# Altium schematic sheet DAP.SchDoc: Skipper DAP
size 297 x 210 mm; Author: Jack Herron; SheetNumber: 9; SheetTotal: 11
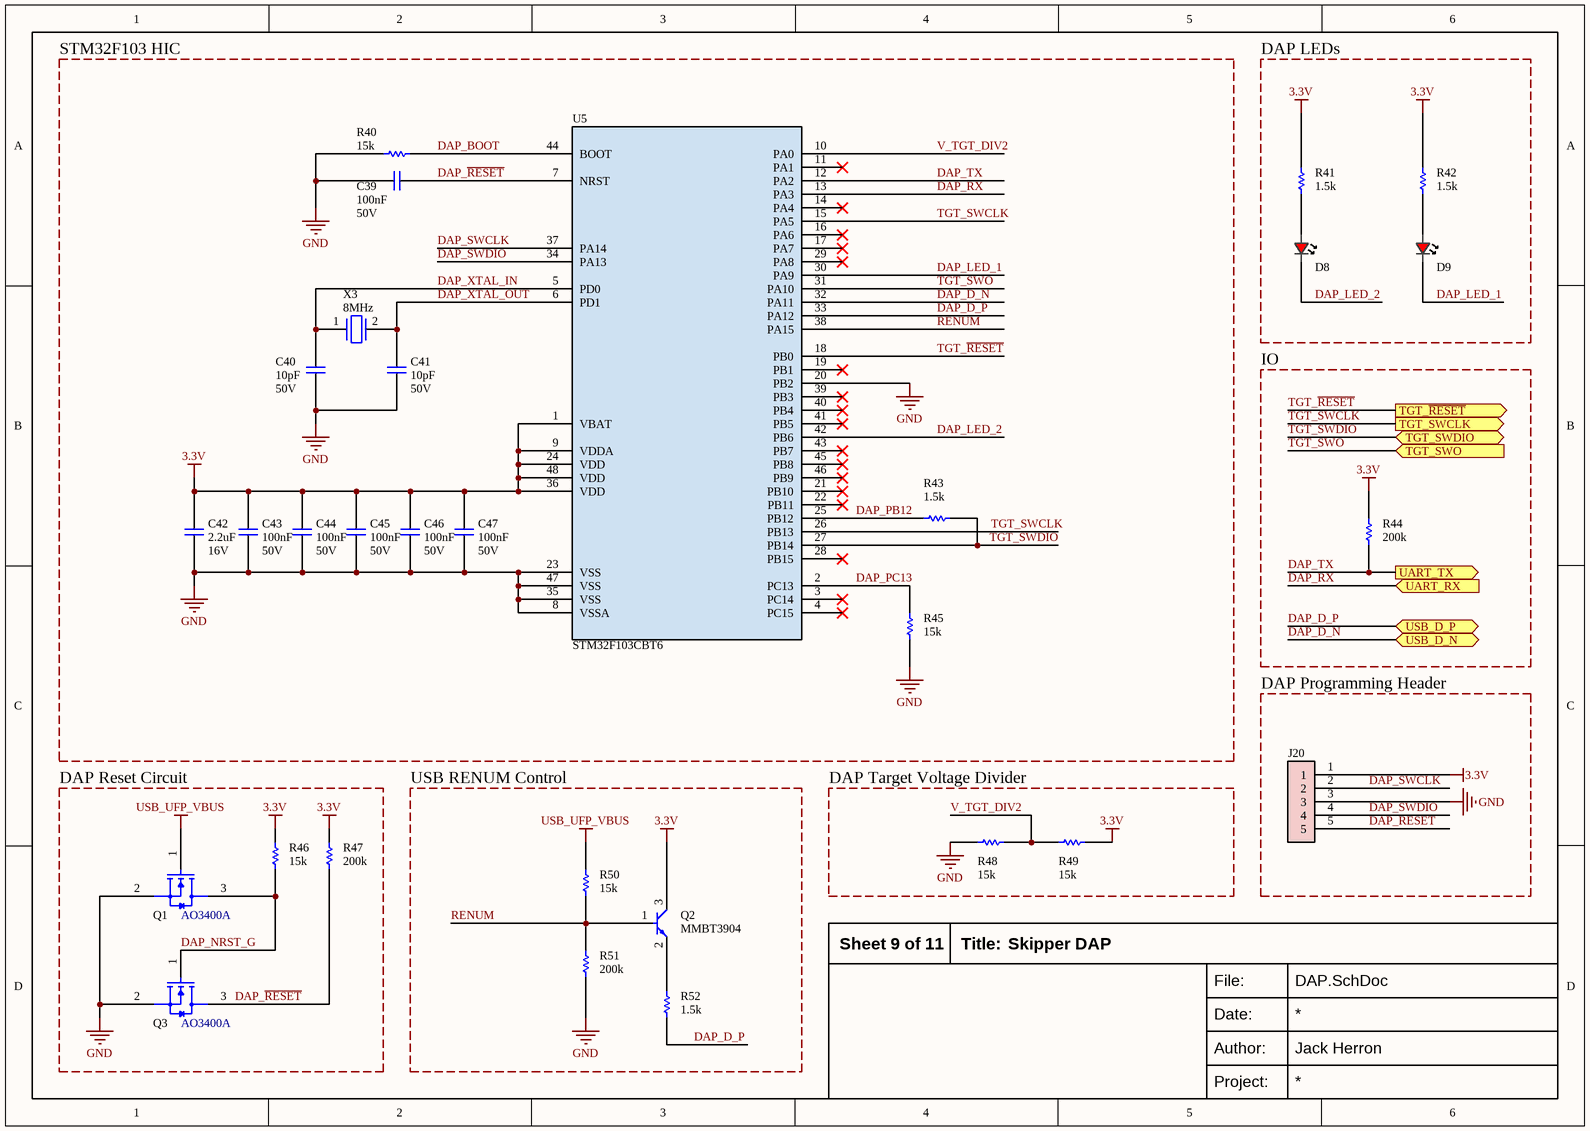
[diagram p0: DAP.SchDoc]

## Parts
C39  value 100nF  Voltage: 50V  [CAPACITOR-0402]  (hidden comment: CL05B104KB54PNC)
C40  value 10pF  Voltage: 50V  [CAPACITOR-0402]  (hidden comment: CL05C100JB5NNNC)
C41  value 10pF  Voltage: 50V  [CAPACITOR-0402]  (hidden comment: CL05C100JB5NNNC)
C42  value 2.2uF  Voltage: 16V  [CAPACITOR-0603]  (hidden comment: CL10A225KO8NNNC)
C43  value 100nF  Voltage: 50V  [CAPACITOR-0402]  (hidden comment: CL05B104KB54PNC)
C44  value 100nF  Voltage: 50V  [CAPACITOR-0402]  (hidden comment: CL05B104KB54PNC)
C45  value 100nF  Voltage: 50V  [CAPACITOR-0402]  (hidden comment: CL05B104KB54PNC)
C46  value 100nF  Voltage: 50V  [CAPACITOR-0402]  (hidden comment: CL05B104KB54PNC)
C47  value 100nF  Voltage: 50V  [CAPACITOR-0402]  (hidden comment: CL05B104KB54PNC)
D8  KT-0603R  [LED-0603]  (value not drawn)
D9  KT-0603R  [LED-0603]  (value not drawn)
J20  Connector_2.54mm-1x5-unpopulated  [CONNECTOR_Header_2.54mm_1x5]  (value not drawn)  (no BOM)
Q1  AO3400A  [SOT23-3]
Q2  MMBT3904  [SOT23-3]
Q3  AO3400A  [SOT23-3]
R40  value 15k  [RESISTOR-0402]  (hidden comment: 0402WGF1502TCE)
R41  value 1.5k  [RESISTOR-0402]  (hidden comment: 0402WGF1501TCE)
R42  value 1.5k  [RESISTOR-0402]  (hidden comment: 0402WGF1501TCE)
R43  value 1.5k  [RESISTOR-0402]  (hidden comment: 0402WGF1501TCE)
R44  value 200k  [RESISTOR-0402]  (hidden comment: 0402WGF2003TCE)
R45  value 15k  [RESISTOR-0402]  (hidden comment: 0402WGF1502TCE)
R46  value 15k  [RESISTOR-0402]  (hidden comment: 0402WGF1502TCE)
R47  value 200k  [RESISTOR-0402]  (hidden comment: 0402WGF2003TCE)
R48  value 15k  [RESISTOR-0402]  (hidden comment: 0402WGF1502TCE)
R49  value 15k  [RESISTOR-0402]  (hidden comment: 0402WGF1502TCE)
R50  value 15k  [RESISTOR-0402]  (hidden comment: 0402WGF1502TCE)
R51  value 200k  [RESISTOR-0402]  (hidden comment: 0402WGF2003TCE)
R52  value 1.5k  [RESISTOR-0402]  (hidden comment: 0402WGF1501TCE)
U5  STM32F103CBT6  [LQFP-48-7x7]
X3  value 8MHz  [CRYSTAL_3225-2P]  (hidden comment: NX3225GD-8MHZ-STD-CRA-3)

## Blocks framed on the sheet
STM32F103 HIC: C39-C47 R40 R43 R45 U5 X3
DAP LEDs: D8 D9 R41 R42
IO: R44
DAP Programming Header: J20
DAP Reset Circuit: Q1 Q3 R46 R47
USB RENUM Control: Q2 R50-R52
DAP Target Voltage Divider: R48 R49

## Ports
TGT_SWCLK (out, see Top_Sheet[3C]), TGT_SWDIO (bidir, see Top_Sheet[3C]), TGT_SWO (in, see Top_Sheet[3C]), TGT_~{RESET} (out, see Top_Sheet[3C]), UART_RX (in, see Top_Sheet[3C]), UART_TX (out, see Top_Sheet[3C]), USB_D_N (bidir, see Top_Sheet[3D]), USB_D_P (bidir, see Top_Sheet[3D])

## Nets
3.3V: C42.2 C43.2 C44.2 C45.2 C46.2 C47.2 J20.1 Q2.3(C) R41.2 R42.2 R44.2 R46.2 R47.2 R49.1 U5.1(VBAT) U5.9(VDDA) U5.24(VDD) U5.36(VDD) U5.48(VDD)
GND: C39.2 C40.1 C41.1 C42.1 C43.1 C44.1 C45.1 C46.1 C47.1 J20.3 Q1.2(S) Q3.2(S) R40.1 R45.1 R48.2 R51.1 U5.8(VSSA) U5.20(PB2) U5.23(VSS) U5.35(VSS) U5.47(VSS)
USB_UFP_VBUS: Q1.1(G) R50.2
DAP_BOOT: R40.2 U5.44(BOOT)
DAP_D_N: U5.32(PA11) ; port USB_D_N
DAP_D_P: R52.1 U5.33(PA12) ; port USB_D_P
DAP_LED_1: D9.K U5.30(PA9)
DAP_LED_2: D8.K U5.42(PB6)
DAP_NRST_G: Q1.3(D) Q3.1(G) R46.1
DAP_PB12: R43.2 U5.25(PB12)
DAP_PC13: R45.2 U5.2(PC13)
DAP_~{RESET}: C39.1 J20.5 Q3.3(D) R47.1 U5.7(NRST)
DAP_RX: U5.13(PA3) ; port UART_RX
DAP_SWCLK: J20.2 U5.37(PA14)
DAP_SWDIO: J20.4 U5.34(PA13)
DAP_TX: R44.1 U5.12(PA2) ; port UART_TX
DAP_XTAL_IN: C40.2 U5.5(PD0) X3.1
DAP_XTAL_OUT: C41.2 U5.6(PD1) X3.2
RENUM: Q2.1(B) R50.1 R51.2 U5.38(PA15)
TGT_~{RESET}: U5.18(PB0) ; port TGT_~{RESET}
TGT_SWCLK: U5.15(PA5) U5.26(PB13) ; port TGT_SWCLK
TGT_SWDIO: R43.1 U5.27(PB14) ; port TGT_SWDIO
TGT_SWO: U5.31(PA10) ; port TGT_SWO
V_TGT_DIV2: R48.1 R49.2 U5.10(PA0)
NetD8_A: D8.A R41.1
NetD9_A: D9.A R42.1
NetQ2_2: Q2.2(E) R52.2

Not connected (* = marked no-connect by the designer): U5 3(PC14)* 4(PC15)* 11(PA1)* 14(PA4)* 16(PA6)* 17(PA7)* 19(PB1)* 21(PB10)* 22(PB11)* 28(PB15)* 29(PA8)* 39(PB3)* 40(PB4)* 41(PB5)* 43(PB7)* 45(PB8)* 46(PB9)*

## Notes on the sheet
- Title:
- File:
- Date:
- Project:
- Author:

## Library data of the parts
C39 C43-C47 = CAPACITOR_CL05B104KB54PNC: Capacitor - 100nF - 50V - 0402 - X7R; Manufacturer 1: Samsung; Manufacturer Part Number 1: CL05B104KB54PNC; Supplier 1: LCSC; Supplier Part Number 1: C307331
C40 C41 = CAPACITOR_CL05C100JB5NNNC: Capacitor - 10pF - 50V - 0402 - C0G; Manufacturer 1: Samsung; Manufacturer Part Number 1: CL05C100JB5NNNC; Supplier 1: LCSC; Supplier Part Number 1: C32949
C42 = CAPACITOR_CL10A225KO8NNNC: Capacitor - 2.2uF - 16V - 0603 - X5R; Manufacturer 1: Samsung; Manufacturer Part Number 1: CL10A225KO8NNNC; Supplier 1: LCSC; Supplier Part Number 1: C23630
D8 D9 = LED_KT-0603R: LED - Red - 0603; Manufacturer 1: Hubei KENTO Elec; Manufacturer Part Number 1: KT-0603R; Supplier 1: LCSC; Supplier Part Number 1: C2286
J20 = CONNECTOR_2.54mm-1x5-unpopulated: Connector - 2.54mm - 1x5 - unpopulated
Q1 Q3 = AO3400A: N Channel Mosfet - 26.5mΩ - SOT23-3; Manufacturer 1: AOS; Manufacturer Part Number 1: AO3400A; Supplier 2: DigiKey; Supplier Part Number 2: 785-1000-1-ND; Supplier 1: LCSC; Supplier Part Number 1: C20917
Q2 = TRANSISTOR_NPN-BJT_MMBT3904: NPN Transistor; Manufacturer 1: Jiangsu Changjing Electronics Technology Co., Ltd.; Manufacturer Part Number 1: MMBT3904; Supplier 1: LCSC; Supplier Part Number 1: C20526
R40 R45 R46 R48-R50 = RESISTOR_0402WGF1502TCE: Resistor - 15k - 0402; Manufacturer 1: UNI-ROYAL; Voltage: 50V; Wattage: 62.5mW; Manufacturer Part Number 1: 0402WGF1502TCE; Supplier 1: LCSC; Supplier Part Number 1: C25756
R41-R43 R52 = RESISTOR_0402WGF1501TCE: Resistor - 1.5k - 0402; Manufacturer 1: UNI-ROYAL; Voltage: 50V; Wattage: 62.5mW; Manufacturer Part Number 1: 0402WGF1501TCE; Supplier 1: LCSC; Supplier Part Number 1: C25867
R44 R47 R51 = RESISTOR_0402WGF2003TCE: Resistor - 200k - 0402; Manufacturer 1: UNI-ROYAL; Wattage: 62.5mW; Voltage: 50V; Manufacturer Part Number 1: 0402WGF2003TCE; Supplier 1: LCSC; Supplier Part Number 1: C25764
U5 = MCU_STM32F103CBT6: Arm Cortex-M3 MCU - 128KB Flash - 20KB SRAM - 72 MHz - LQFP48; Manufacturer 1: STMicroelectronics; Manufacturer Part Number 1: STM32F103CBT6; Supplier 1: LCSC; Supplier Part Number 1: C8304
X3 = CRYSTAL_NX3225GD-8MHZ-STD-CRA-3: 8Mhz crystal 3225-2P; Manufacturer 1: NDK; Manufacturer Part Number 1: NX3225GD-8MHZ-STD-CRA-3; Supplier 1: LCSC; Supplier Part Number 1: C889706